# Altium schematic sheet Codec.SchDoc
size A4; SheetNumber: 6; SheetTotal: 8
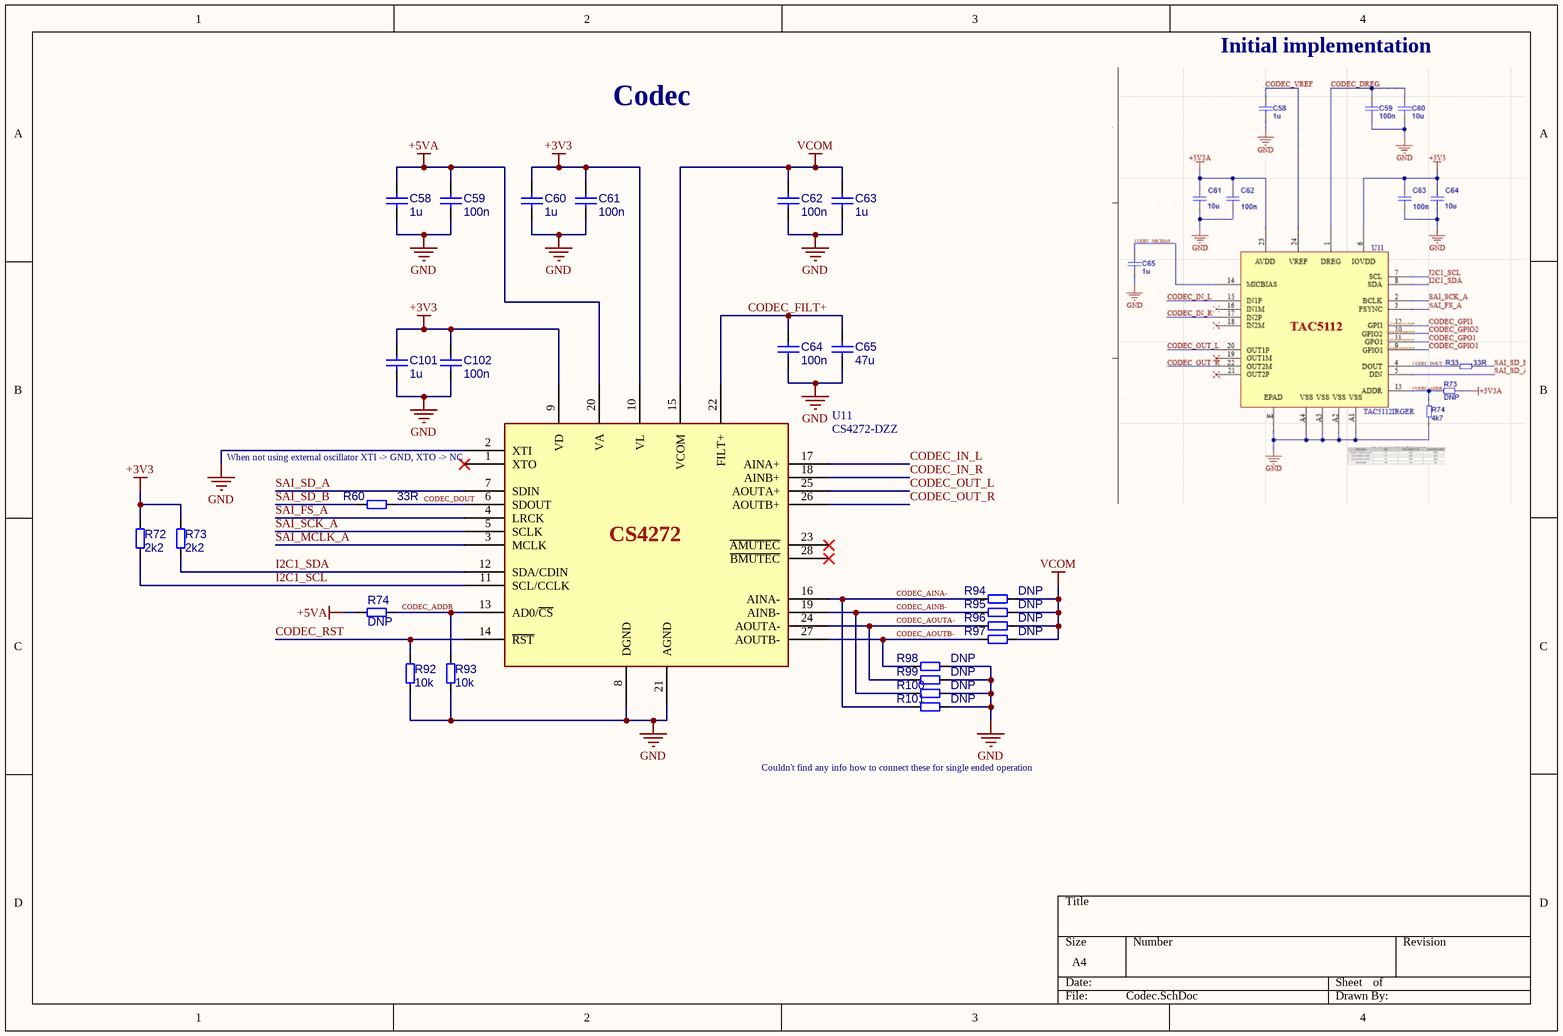
[diagram p0: Codec.SchDoc]

## Parts
C58  1u  [C_0402]
C59  100n  [CAPC1005X50N_0402]
C60  1u  [C_0402]
C61  100n  [CAPC1005X50N_0402]
C62  100n  [CAPC1005X50N_0402]
C63  1u  [C_0402]
C64  100n  [CAPC1005X50N_0402]
C65  47u  [C_1210]
C101  1u  [C_0402]
C102  100n  [CAPC1005X50N_0402]
R60  33R  [R_0402]
R72  2k2  [R_0603]
R73  2k2  [R_0603]
R74  DNP  [R_0603]
R92  10k  [R_0603]
R93  10k  [R_0603]
R94  DNP  [R_0402]
R95  DNP  [R_0402]
R96  DNP  [R_0402]
R97  DNP  [R_0402]
R98  DNP  [R_0402]
R99  DNP  [R_0402]
R100  DNP  [R_0402]
R101  DNP  [R_0402]
U11  CS4272-DZZ  [TSSOP-28_CS4272]

## Nets
+3V3: C60.1 C61.1 C101.1 C102.1 R72.2 R73.2 U11.9(VD) U11.10(VL)
+5VA: C58.1 C59.1 R74.2 U11.20(VA)
GND: C58.2 C59.2 C60.2 C61.2 C62.2 C63.2 C64.2 C65.1 C101.2 C102.2 R92.1 R93.1 R98.2 R99.2 R100.2 R101.2 U11.2(XTI) U11.8(DGND) U11.21(AGND)
VCOM: C62.1 C63.1 R94.2 R95.2 R96.2 R97.2 U11.15(VCOM)
CODEC_ADDR: R74.1 R93.2 U11.13(AD0/~{CS})
CODEC_AINA-: R94.1 R101.1 U11.16(AINA-)
CODEC_AINB-: R95.1 R100.1 U11.19(AINB-)
CODEC_AOUTA-: R96.1 R99.1 U11.24(AOUTA-)
CODEC_AOUTB-: R97.1 R98.1 U11.27(AOUTB-)
CODEC_DOUT: R60.2 U11.6(SDOUT)
CODEC_FILT+: C64.1 C65.2 U11.22(FILT+)
CODEC_IN_L: U11.17(AINA+)
CODEC_IN_R: U11.18(AINB+)
CODEC_OUT_L: U11.25(AOUTA+)
CODEC_OUT_R: U11.26(AOUTB+)
CODEC_RST: R92.2 U11.14(~{RST})
I2C1_SCL: R72.1 U11.11(SCL/CCLK)
I2C1_SDA: R73.1 U11.12(SDA/CDIN)
SAI_FS_A: U11.4(LRCK)
SAI_MCLK_A: U11.3(MCLK)
SAI_SCK_A: U11.5(SCLK)
SAI_SD_A: U11.7(SDIN)
SAI_SD_B: R60.1

Not connected (* = marked no-connect by the designer): U11 1(XTO)* 23(~{AMUTEC})* 28(~{BMUTEC})*

## Notes on the sheet
- Codec
- Initial implementation
- (near U11) When not using external oscillator XTI -> GND, XTO -> NC
- Couldn't find any info how to connect these for single ended operation
- (in symbol CMP-015-00011-3) CS4272

## Library data of the parts
C58 C60 C63 C101 = CMP-001-00085-2: MLCC 0603
C59 C61 C62 C64 C102 = CMP-001-00084-2: MLCC 0402
C65 = CMP-001-00088-1: 1210, X5R:EIA, 100uF, DC6.3V, GRM32ER60J107ME20
R60 R94-R101 = CMP-009-00178-3: Chip 0402 resistor
R72-R74 R92 R93 = CMP-009-00177-7: Chip resistor 0603
U11 = CMP-015-00011-3: PCM Audio Codec, 2ADC/2DAC Ch, Automotive, 28-Pin TSSOP Tube; Number of Circuits: 1; Max Supply Current: 53mA; Sampling Rate: 192ksps; Number of Bits: 24; Number of A/D Converters: 2; Max Supply Voltage: 5.25V; Resolution: 3B; Interface: I2C, SPI; Signal to Noise Ratio (SNR): 114dB; Min Supply Voltage: 4.75V; Nominal Supply Current: 45mA; Pins: 28; Number of Terminals: 28; Introduction Date: 2003-01-21; RoHS: Compliant; Terminal Pitch: 650µm; Min Operating Temperature: -40°C; LTB Date: 2021-04-19; LTD Date: 2021-04-19; Type: General Purpose; Temperature Grade: Industrial; Max Operating Temperature: 85°C; Number of Channels: 2; Mounting Technology: Surface Mount; Height - Seated (Max): 1.2mm; Termination: SMD/SMT; Length: 9.7mm; Number of D/A Converters: 2; Lifecycle Status: Obsolete; REACH SVHC: Unaffected; Contact Plating: Tin; Width: 4.4mm; Case/Package: TSSOP